# Altium schematic sheet MCU.SchDoc: ?
size A3; Organization: VGTU; Address1: Elektronikos fakultetas; Address2: Kompiuterių inžinerijos katedra; Address3: Naugarduko 41; Address4: Vilnius, Lietuva; Revision: ?; SheetNumber: ?; SheetTotal: ?
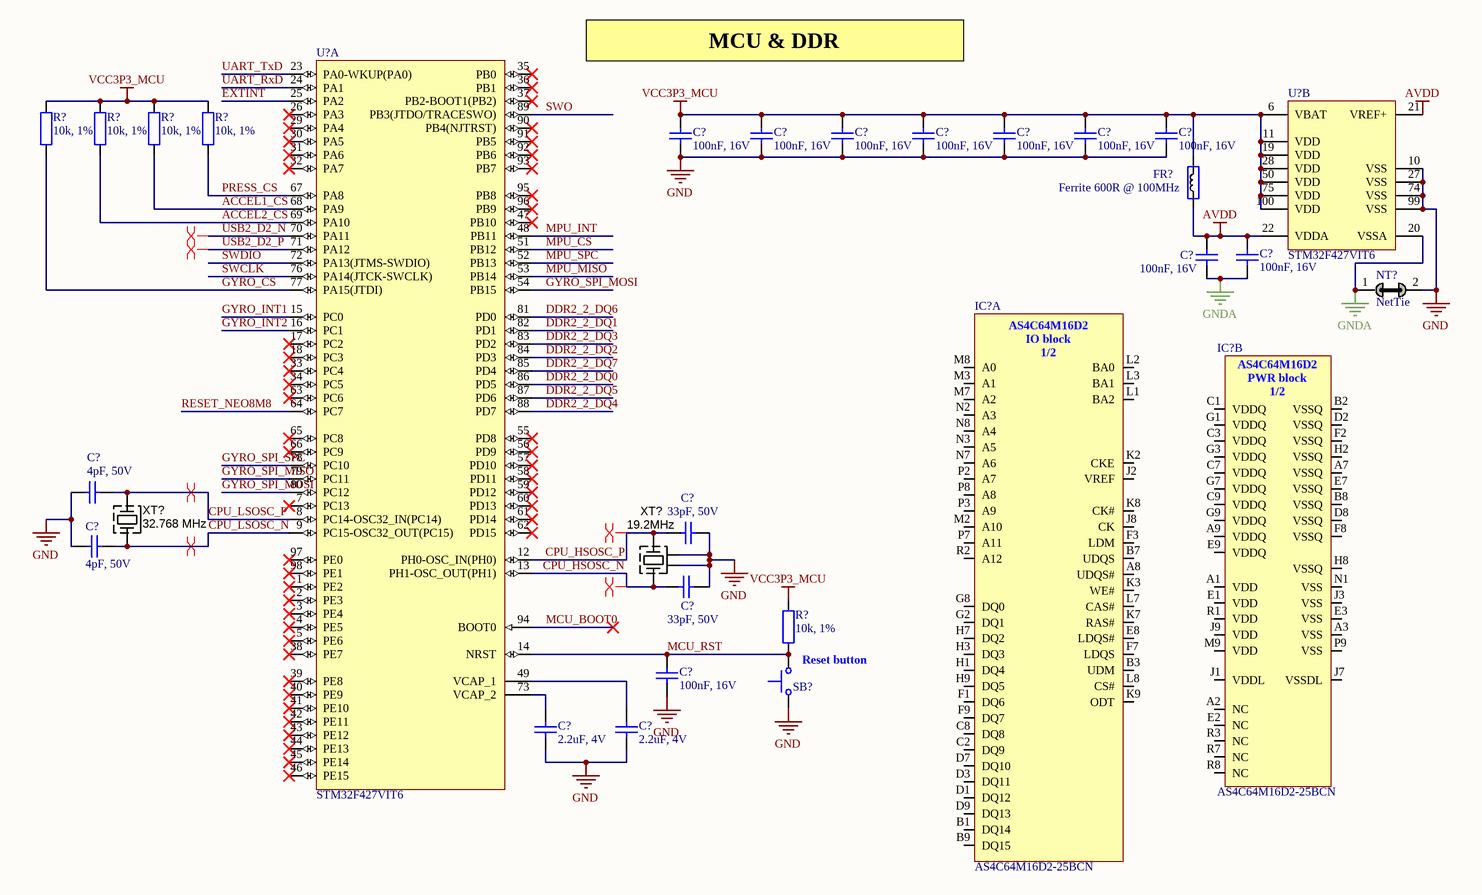
[diagram p0: MCU.SchDoc]

## Parts
(Parts that share a designator on the sheet are numbered #1, #2 ... from top to bottom, then left to right.)
C?#1  100nF, 16V  [CAP0402]
C?#2  100nF, 16V  [CAP0402]
C?#3  100nF, 16V  [CAP0402]
C?#4  100nF, 16V  [CAP0402]
C?#5  100nF, 16V  [CAP0402]
C?#6  100nF, 16V  [CAP0402]
C?#7  100nF, 16V  [CAP0402]
C?#8  100nF, 16V  [CAP0402]
C?#9  100nF, 16V  [CAP0402]
C?#10  4pF, 50V  [CAP0402]
C?#11  33pF, 50V  [CAP0402]
C?#12  4pF, 50V  [CAP0402]
C?#13  33pF, 50V  [CAP0402]
C?#14  100nF, 16V  [CAP0402]
C?#15  2.2uF, 4V  [CAP0402]
C?#16  2.2uF, 4V  [CAP0402]
FR?  Ferrite 600R @ 100MHz  [RES0402]
IC?#1  AS4C64M16D2-25BCN  [AS4C64M16D2]  (part A of 2)
IC?#2  AS4C64M16D2-25BCN  [AS4C64M16D2]  (part B of 2)
NT?  NetTie  [NetTie_Narrow2]  (net tie, no BOM)
R?#1  10k, 1%  [RES0402]
R?#2  10k, 1%  [RES0402]
R?#3  10k, 1%  [RES0402]
R?#4  10k, 1%  [RES0402]
R?#5  10k, 1%  [RES0402]
SB?  Button  (value not drawn)
U?#1  STM32F427VIT6  [STM-LQFP100_M]  (part A of 2)
U?#2  STM32F427VIT6  [STM-LQFP100_M]  (part B of 2)
XT?#1  32.768 MHz  [CRYSTAL_v2]
XT?#2  19.2MHz  [CRYSTAL_4-LCC]

## Nets
AVDD: C?#8.1 C?#9.1 FR?.1 U?#2.21(VREF+) U?#2.22(VDDA)
GND: C?#1.2 C?#2.2 C?#3.2 C?#4.2 C?#5.2 C?#6.2 C?#7.2 C?#10.1 C?#11.1 C?#12.1 C?#13.1 C?#14.2 C?#15.2 C?#16.2 NT?.2 SB?.1 U?#2.10(VSS) U?#2.27(VSS) U?#2.74(VSS) U?#2.99(VSS) XT?#2.2(GND) XT?#2.4(GND)
GNDA: C?#8.2 C?#9.2 NT?.1 U?#2.20(VSSA)
VCC3P3_MCU: C?#1.1 C?#2.1 C?#3.1 C?#4.1 C?#5.1 C?#6.1 C?#7.1 FR?.2 R?#1.2 R?#2.2 R?#3.2 R?#4.2 R?#5.2 U?#2.6(VBAT) U?#2.11(VDD) U?#2.19(VDD) U?#2.28(VDD) U?#2.50(VDD) U?#2.75(VDD) U?#2.100(VDD)
ACCEL1_CS: R?#3.1 U?#1.68(PA9)
ACCEL2_CS: R?#2.1 U?#1.69(PA10)
CPU_HSOSC_N: C?#13.2 U?#1.13(PH1-OSC_OUT(PH1)) XT?#2.1(X)
CPU_HSOSC_P: C?#11.2 U?#1.12(PH0-OSC_IN(PH0)) XT?#2.3(X)
CPU_LSOSC_N: C?#12.2 U?#1.9(PC15-OSC32_OUT(PC15)) XT?#1.1(X)
CPU_LSOSC_P: C?#10.2 U?#1.8(PC14-OSC32_IN(PC14)) XT?#1.2(X)
DDR2_2_DQ0: U?#1.86(PD5)
DDR2_2_DQ1: U?#1.82(PD1)
DDR2_2_DQ2: U?#1.84(PD3)
DDR2_2_DQ3: U?#1.83(PD2)
DDR2_2_DQ4: U?#1.88(PD7)
DDR2_2_DQ5: U?#1.87(PD6)
DDR2_2_DQ6: U?#1.81(PD0)
DDR2_2_DQ7: U?#1.85(PD4)
EXTINT: U?#1.25(PA2)
GYRO_CS: R?#1.1 U?#1.77(PA15(JTDI))
GYRO_INT1: U?#1.15(PC0)
GYRO_INT2: U?#1.16(PC1)
GYRO_SPI_MISO: U?#1.79(PC11)
GYRO_SPI_MOSI: U?#1.54(PB15) U?#1.80(PC12)
GYRO_SPI_SPC: U?#1.78(PC10)
MCU_BOOT0: U?#1.94(BOOT0)
MCU_RST: C?#14.1 R?#5.1 SB?.2 U?#1.14(NRST)
MPU_CS: U?#1.51(PB12)
MPU_INT: U?#1.48(PB11)
MPU_MISO: U?#1.53(PB14)
MPU_SPC: U?#1.52(PB13)
PRESS_CS: R?#4.1 U?#1.67(PA8)
RESET_NEO8M8: U?#1.64(PC7)
SWCLK: U?#1.76(PA14(JTCK-SWCLK))
SWDIO: U?#1.72(PA13(JTMS-SWDIO))
SWO: U?#1.89(PB3(JTDO/TRACESWO))
UART_RxD: U?#1.24(PA1)
UART_TxD: U?#1.23(PA0-WKUP(PA0))
USB2_D2_N: U?#1.70(PA11)
USB2_D2_P: U?#1.71(PA12)
NetC?#15_1: C?#15.1 U?#1.73(VCAP_2)
NetC?#16_1: C?#16.1 U?#1.49(VCAP_1)

Not connected (* = marked no-connect by the designer): IC?#1 A8(UDQS#) B1(DQ14) B3(UDM) B7(UDQS) B9(DQ15) C2(DQ9) C8(DQ8) D1(DQ12) D3(DQ11) D7(DQ10) D9(DQ13) E8(LDQS#) F1(DQ6) F3(LDM) F7(LDQS) F9(DQ7) G2(DQ1) G8(DQ0) H1(DQ4) H3(DQ3) H7(DQ2) H9(DQ5) J2(VREF) J8(CK) K2(CKE) K3(WE#) K7(RAS#) K8(CK#) K9(ODT) L1(BA2) L2(BA0) L3(BA1) L7(CAS#) L8(CS#) M2(A10) M3(A1) M7(A2) M8(A0) N2(A3) N3(A5) N7(A6) N8(A4) P2(A7) P3(A9) P7(A11) P8(A8) R2(A12); IC?#2 A1(VDD) A2(NC) A3(VSS) A7(VSSQ) A9(VDDQ) B2(VSSQ) B8(VSSQ) C1(VDDQ) C3(VDDQ) C7(VDDQ) C9(VDDQ) D2(VSSQ) D8(VSSQ) E1(VDD) E2(NC) E3(VSS) E7(VSSQ) E9(VDDQ) F2(VSSQ) F8(VSSQ) G1(VDDQ) G3(VDDQ) G7(VDDQ) G9(VDDQ) H2(VSSQ) H8(VSSQ) J1(VDDL) J3(VSS) J7(VSSDL) J9(VDD) M9(VDD) N1(VSS) P9(VSS) R1(VDD) R3(NC) R7(NC) R8(NC); U?#1 1(PE2)* 2(PE3)* 3(PE4)* 4(PE5)* 5(PE6)* 7(PC13)* 17(PC2)* 18(PC3)* 26(PA3)* 29(PA4)* 30(PA5)* 31(PA6)* 32(PA7)* 33(PC4)* 34(PC5)* 35(PB0)* 36(PB1)* 37(PB2-BOOT1(PB2))* 38(PE7)* 39(PE8)* 40(PE9)* 41(PE10)* 42(PE11)* 43(PE12)* 44(PE13)* 45(PE14)* 46(PE15)* 47(PB10)* 55(PD8)* 56(PD9)* 57(PD10)* 58(PD11)* 59(PD12)* 60(PD13)* 61(PD14)* 62(PD15)* 63(PC6)* 65(PC8)* 66(PC9)* 90(PB4(NJTRST))* 91(PB5)* 92(PB6)* 93(PB7)* 95(PB8)* 96(PB9)* 97(PE0)* 98(PE1)*

## Layout directives
differential pair: CPU_HSOSC_N, CPU_HSOSC_P, CPU_LSOSC_N, CPU_LSOSC_P, USB2_D2_N, USB2_D2_P

## Notes on the sheet
- MCU & DDR
- Reset button
- Title
- Size:
- Date:
- A4
- Revision:
- Time:
- Sheet
- of
- File:
- (in symbol AS4C64M16D2-25BCN, part A) AS4C64M16D2 / IO block / 1/2
- (in symbol AS4C64M16D2-25BCN, part B) AS4C64M16D2 / PWR block / 1/2

## Library data of the parts
C?#1-C?#16 = Cap: Value: *
FR? = Ferrite
IC?#1 IC?#2 = AS4C64M16D2-25BCN: Manufacturer: Alliance Memory, Inc.; Speed: 400MHz; Interface: Parallel; Memory Type: DDR2 SDRAM; Memory Size: 1G (64M x 16); Voltage - Supply: 1.7 V ~ 1.9 V; Format - Memory: RAM; Supplier 1: Digi-Key; Package / Case: 84-TFBGA; Supplier Device Package: 84-FBGA (8x12.5); Manufacturer Part Number 1: AS4C64M16D2-25BCN; RoHS: RoHS Compliant; Operating Temperature: 0°C ~ 70°C; Category: Integrated Circuits (ICs); Packaging: Tray; Supplier Part Number 1: 1450-1158-ND
R?#1-R?#5 = Res: Value: *
U?#1 U?#2 = STM32F427VIT6: ARM Cortex-M4 32-bit MCU+FPU, 210 DMIPS, 2048 kB Flash, 256 kB Internal RAM, 82 I/Os, 100-pin LQFP, -40 to 85 degC, Tray; Manufacturer: STMicroelectronics; D/A Converter: 2x12-bit; FLASH Size (Prog) (kB): 2048; I/Os (High Current): 82; Internal RAM Size (kB): 256; Operating Frequency(F) (Processor speed) (MHz): 168; Supply Voltage(Vcc) max (V): 3.6; Supply Voltage(Vcc) min (V): 1.8; DatasheetVersion: Rev. 1; PackageVersion: Rev. 1, 06/2013; PackageReference: LQFP100; PackageDescription: 100-Pin Low Profile Quad Flat Package, 14 x 14 mm Body, 0.5 mm Pitch; Supplier 1: Digi-Key; Supplier Part Number 1: 497-14049-ND; Supplier 2: Farnell; Supplier Part Number 2: 2333369; Supplier 3: Newark; Supplier Part Number 3: 99W9927; Supplier 4: Newark; Supplier Part Number 4: 66W7312; Supplier 5: Mouser; Supplier Part Number 5: 511-STM32F427VIT6; Core: ARM Cortex-M4; Packing: Tray; Mounting Technology: Surface Mount; PartNumber: STM32F427VIT6; ComponentLink1Description: Manufacturer URL; ComponentLink1URL: http://www.st.com/web/en/home.html; ComponentLink2Description: Datasheet; ComponentLink2URL: http://www.st.com/st-web-ui/static/active/en/resource/technical/document/datasheet/DM00071990.pdf; ComponentLink3Description: Package Specification; ComponentLink3URL: http://www.st.com/st-web-ui/static/active/en/resource/technical/document/data_brief/DM00071938.pdf
XT?#1 = CRYSTAL_v2: Manufacturer Part Number 1: ABS07-LR-32.768KHZ-6-T; Manufacturer: Abracon LLC; Load Capacitance: 6pF; Operating Mode: Fundamental; ESR (Equivalent Series Resistance): 50 kOhm; Frequency: 32.768kHz; Frequency Tolerance: ±20ppm; Supplier 1: Digi-Key; Category: Crystals and Oscillators; Mounting Type: Surface Mount; Operating Temperature: -40°C ~ 85°C; Frequency Stability: -; Type: kHz Crystal (Tuning Fork); Size / Dimension: 0.126" L x 0.061" W (3.20mm x 1.50mm); Package / Case: 2-SMD; RoHS: RoHS Compliant; Ratings: -; Height: 0.035" (0.90mm); Packaging: Cut Tape (CT); Supplier Part Number 1: 535-12942-1-ND
XT?#2 = CRYSTAL_19M2: Oscillator Crystal 27.12 MHz 10ppm; Manufacturer 1: TXC CORPORATION; Manufacturer Part Number 1: 7M-27.120MEEQ-T; Ratings: 4.9152 MHz Crystal; Load Capacitance: 10pF; Operating Mode: Fundamental; Package / Case: 2.5mm pitch; Material: Ceramic; Supplier 1: Digi-Key; Supplier Part Number 1: 887-1329-1-ND; Type: MHz Crystal; Frequency Stability: ±10ppm; Frequency Tolerance: ±10ppm; Operating Temperature: -20°C ~ 70°C; Mounting Type: Surface Mount; Size / Dimension: 0.126" L x 0.098" W (3.20mm x 2.50mm); ComponentLink1URL: http://www.txccrystal.com/images/pdf/7m-accuracy.pdf; ComponentLink1Description: http://www.txccrystal.com/images/pdf/7m-accuracy.pdf